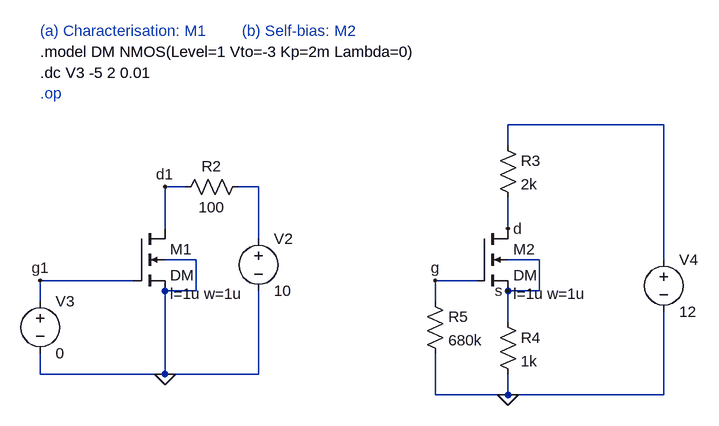
[diagram p0: schematic Ex05.asc]
Ex05.asc, the LTspice schematic file:
Version 4.1
SHEET 1 1200 800
WIRE 480 -64 240 -64
WIRE 240 -32 240 -64
WIRE -256 32 -288 32
WIRE -144 32 -176 32
WIRE -288 96 -288 32
WIRE 240 96 240 48
WIRE -144 112 -144 32
WIRE -240 144 -288 144
WIRE 288 144 240 144
WIRE 480 144 480 -64
WIRE -336 176 -480 176
WIRE 192 176 128 176
WIRE -240 192 -240 144
WIRE -240 192 -288 192
WIRE 288 192 288 144
WIRE 288 192 240 192
WIRE -480 208 -480 176
WIRE 128 208 128 176
WIRE 240 240 240 192
WIRE -480 320 -480 288
WIRE -288 320 -288 192
WIRE -288 320 -480 320
WIRE -144 320 -144 192
WIRE -144 320 -288 320
WIRE 128 352 128 288
WIRE 240 352 240 320
WIRE 240 352 128 352
WIRE 480 352 480 224
WIRE 480 352 240 352
FLAG -288 320 0
FLAG -288 32 d1
FLAG -480 176 g1
FLAG 240 352 0
FLAG 240 192 s
FLAG 240 96 d
FLAG 128 176 g
SYMBOL nmos4 -336 96 R0
WINDOW 39 56 100 Left 2
SYMATTR SpiceLine l=1u w=1u
SYMATTR InstName M1
SYMATTR Value DM
SYMBOL voltage -480 192 R0
SYMATTR InstName V3
SYMATTR Value 0
SYMBOL voltage -144 96 R0
SYMATTR InstName V2
SYMATTR Value 10
SYMBOL res -160 16 R90
WINDOW 0 0 56 VBottom 2
WINDOW 3 32 56 VTop 2
SYMATTR InstName R2
SYMATTR Value 100
SYMBOL nmos4 192 96 R0
WINDOW 39 56 100 Left 2
SYMATTR SpiceLine l=1u w=1u
SYMATTR InstName M2
SYMATTR Value DM
SYMBOL res 224 -48 R0
SYMATTR InstName R3
SYMATTR Value 2k
SYMBOL res 224 224 R0
SYMATTR InstName R4
SYMATTR Value 1k
SYMBOL res 112 192 R0
SYMATTR InstName R5
SYMATTR Value 680k
SYMBOL voltage 480 128 R0
SYMATTR InstName V4
SYMATTR Value 12
TEXT -480 -176 Left 2 !.model DM NMOS(Level=1 Vto=-3 Kp=2m Lambda=0)
TEXT -480 -144 Left 2 !.dc V3 -5 2 0.01
TEXT -480 -112 Left 2 ;.op
TEXT -480 -208 Left 2 ;(a) Characterisation: M1        (b) Self-bias: M2

The netlist it stands for:
* Ex05.asc
M1 d1 g1 0 0 DM l=1u w=1u
V3 g1 0 0
V2 N002 0 10
R2 N002 d1 100
M2 d g s s DM l=1u w=1u
R3 N001 d 2k
R4 s 0 1k
R5 g 0 680k
V4 N001 0 12
.model NMOS NMOS
.model PMOS PMOS
.lib standard.mos
.model DM NMOS(Level=1 Vto=-3 Kp=2m Lambda=0)
.dc V3 -5 2 0.01
* .op
* (a) Characterisation: M1        (b) Self-bias: M2
.backanno
.end